# EAGLE design carga (EAGLE 9.6.2)
Carga de prueba R_L 10/20 ohm
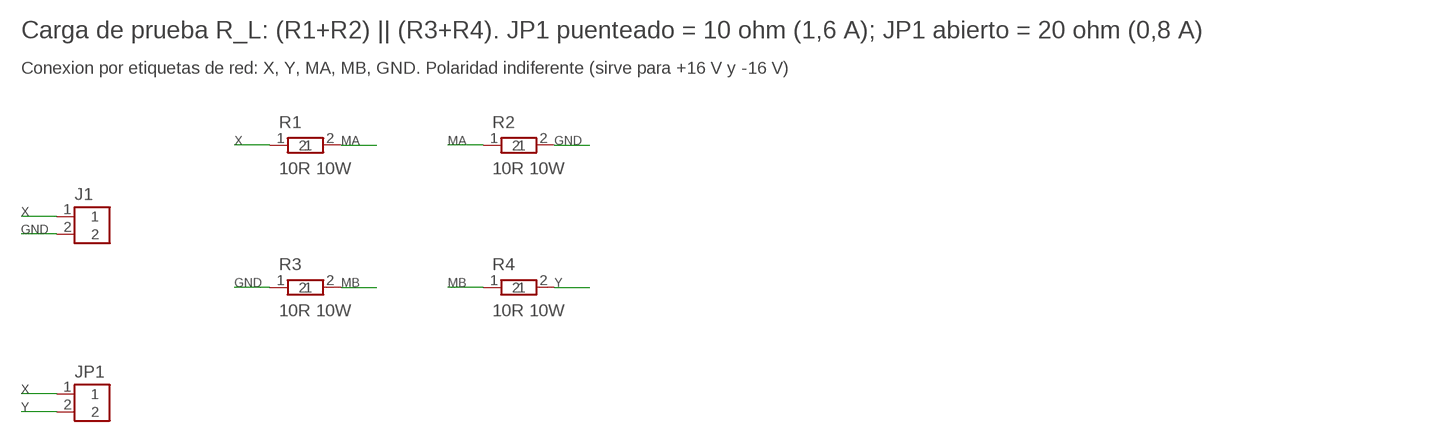
[diagram p0: schematic, sheet 1]

## Parts
J1  A J4 o J5  TERM2  [TERM2]
JP1  SEL 10/20R  TERM2  [TERM2]
R1  10R 10W  R10W  [R10W]
R2  10R 10W  R10W  [R10W]
R3  10R 10W  R10W  [R10W]
R4  10R 10W  R10W  [R10W]

## Nets
GND: J1.2 R2.2 R3.1
MA: R1.2 R2.1
MB: R3.2 R4.1
X: J1.1 JP1.1 R1.1
Y: JP1.2 R4.2

## Notes on the sheet
- Carga de prueba R_L: (R1+R2) || (R3+R4). JP1 puenteado = 10 ohm (1,6 A); JP1 abierto = 20 ohm (0,8 A)
- Conexion por etiquetas de red: X, Y, MA, MB, GND. Polaridad indiferente (sirve para +16 V y -16 V)

## Library data of the parts
J1 JP1 = carga:TERM2
R1-R4 = carga:R10W

## Board
Carga de prueba R_L 10/20 ohm para la fuente +-16 V (una cara)
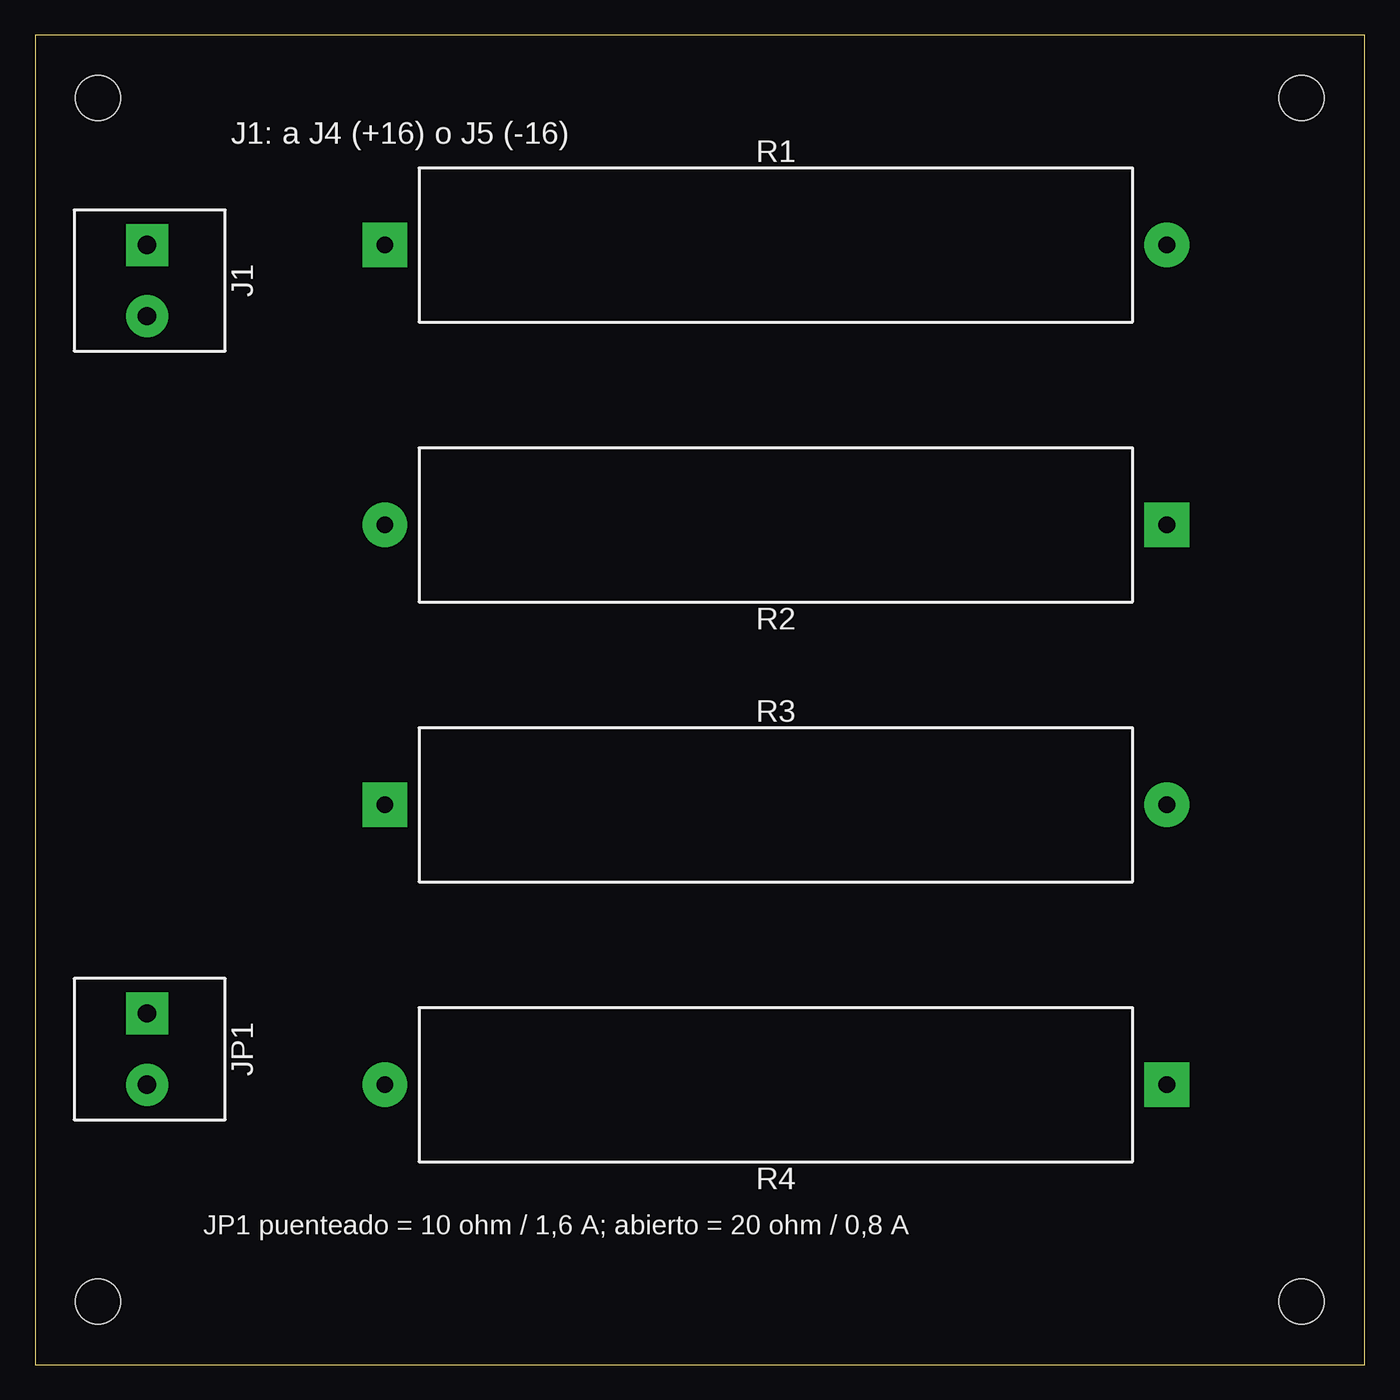
[diagram p1: board, top side]
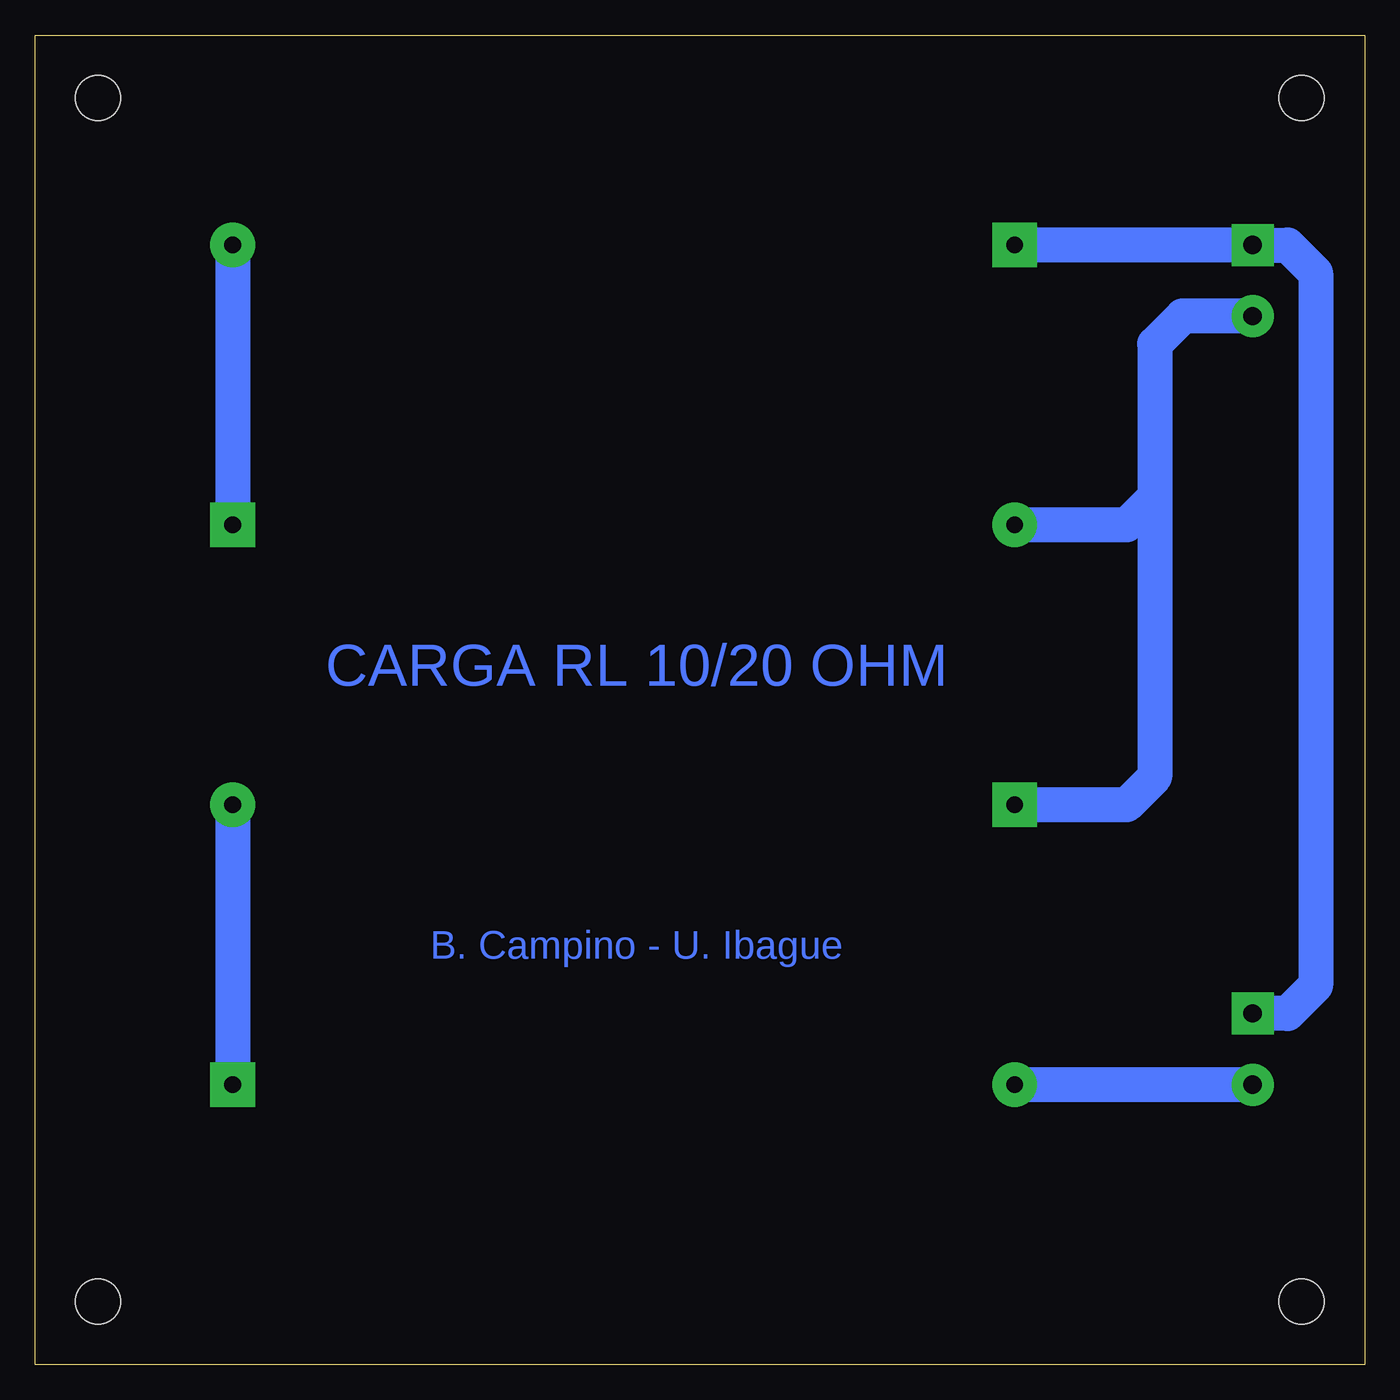
[diagram p2: board, bottom side, seen from below]

Size 95 x 95 mm. Coordinates in mm from the lower left corner, seen from the top.
Outline: 0,0 95,0 95,95 0,95 0,0
Copper layers (1*16): Top / Bottom
Design rules "default": minimum track width 2.5mm, track to track 0.4mm, track to pad 0.4mm, pad to pad 0.4mm, copper to edge 1mm
Holes 3.2 mm at 4.5,4.5 90.5,4.5 4.5,90.5 90.5,90.5

### Footprints (pad centres in the part's own frame; a part is rotated, then mirrored left to right if it is on the bottom)
TERM2 = drill 1.3 pad 3 square: 1 0,0 | drill 1.3 pad 3 round: 2 5.08,0
R10W = drill 1.2 pad 3.2 square: 1 0,0 | drill 1.2 pad 3.2 round: 2 55.88,0

### Placement (x,y rotation side)
J1  8,80 270 top
JP1  8,25.08 270 top
R1  25,80 0 top
R2  80.88,60 180 top
R3  25,40 0 top
R4  80.88,20 180 top

### Tracks (layer width: path | path; a pad name or v marks a point on that pad's centre or on a via)
GND
  Bottom 2.5: J1.2 13,74.92 15,72.92 15,42 17,40 R3.1 | 15,62 17,60 R2.2
MA
  Bottom 2.5: R1.2 R2.1
MB
  Bottom 2.5: R3.2 R4.1
X
  Bottom 2.5: R1.1 J1.1 5.5,80 3.5,78 3.5,27.08 5.5,25.08 JP1.1
Y
  Bottom 2.5: JP1.2 R4.2

### Text on the board
Bottom: CARGA RL 10/20 OHM | B. Campino - U. Ibague
tPlace: J1: a J4 (+16) o J5 (-16) | JP1 puenteado = 10 ohm / 1,6 A; abierto = 20 ohm / 0,8 A